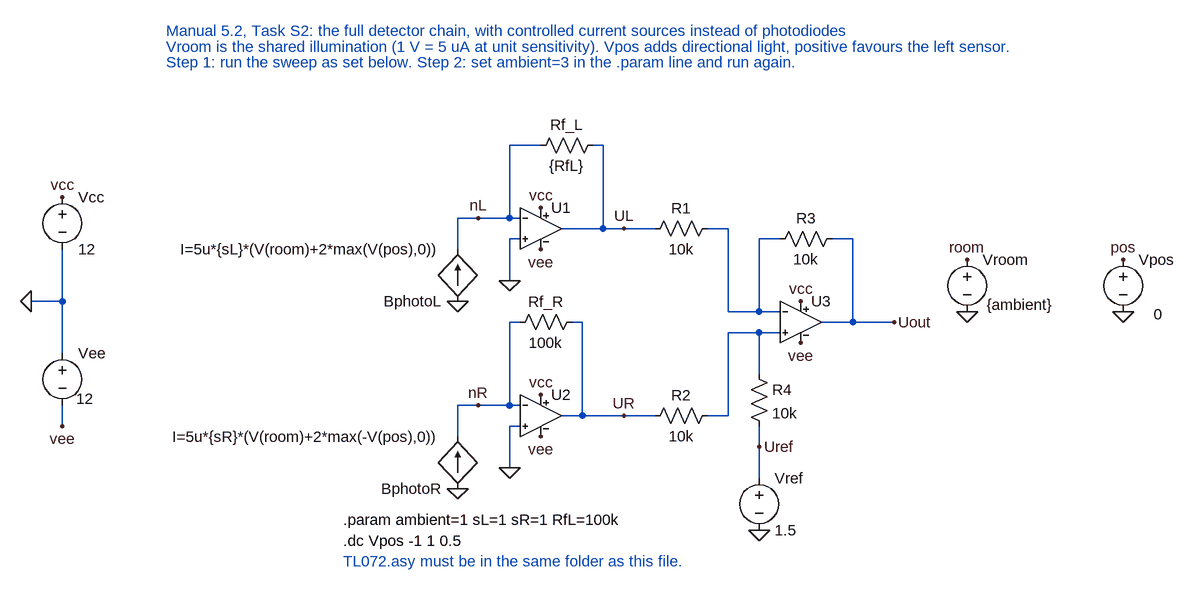
[diagram p0: schematic 5.2_S2_photocurrent_chain_student.asc]
5.2_S2_photocurrent_chain_student.asc, the LTspice schematic file:
Version 4.1
SHEET 1 1536 820
WIRE 400 128 352 128
WIRE 496 128 480 128
WIRE 304 240 272 240
WIRE 352 240 352 128
WIRE 352 240 304 240
WIRE 368 240 352 240
WIRE 496 256 496 128
WIRE 496 256 432 256
WIRE 528 256 496 256
WIRE 576 256 528 256
WIRE 688 256 656 256
WIRE 368 272 352 272
WIRE 768 272 736 272
WIRE 880 272 848 272
WIRE 272 288 272 240
WIRE 352 336 352 272
WIRE -336 368 -336 288
WIRE -336 368 -384 368
WIRE 688 384 688 256
WIRE 736 384 736 272
WIRE 736 384 688 384
WIRE 768 384 736 384
WIRE 368 400 352 400
WIRE 464 400 448 400
WIRE 880 400 880 272
WIRE 880 400 832 400
WIRE 944 400 880 400
WIRE 736 416 688 416
WIRE 768 416 736 416
WIRE -336 448 -336 368
WIRE 736 480 736 416
WIRE 304 528 272 528
WIRE 352 528 352 400
WIRE 352 528 304 528
WIRE 368 528 352 528
WIRE 464 544 464 400
WIRE 464 544 432 544
WIRE 528 544 464 544
WIRE 576 544 528 544
WIRE 688 544 688 416
WIRE 688 544 656 544
WIRE -336 560 -336 528
WIRE 368 560 352 560
WIRE 272 576 272 528
WIRE 736 592 736 560
WIRE 352 624 352 560
WIRE 736 640 736 592
FLAG 304 240 nL
FLAG 352 336 0
FLAG 400 224 vcc
FLAG 400 288 vee
FLAG 272 368 0
FLAG 528 256 UL
FLAG 304 528 nR
FLAG 352 624 0
FLAG 400 512 vcc
FLAG 400 576 vee
FLAG 272 656 0
FLAG 528 544 UR
FLAG 800 368 vcc
FLAG 800 432 vee
FLAG 944 400 Uout
FLAG 736 592 Uref
FLAG 736 720 0
FLAG -336 208 vcc
FLAG -384 368 0
FLAG -336 560 vee
FLAG 1056 304 room
FLAG 1056 384 0
FLAG 1296 304 pos
FLAG 1296 384 0
SYMBOL TL072 400 256 R0
SYMATTR InstName U1
SYMBOL TL072 400 544 R0
SYMATTR InstName U2
SYMBOL TL072 800 400 R0
SYMATTR InstName U3
SYMBOL bi 272 368 R180
SYMATTR InstName BphotoL
SYMATTR Value I=5u*{sL}*(V(room)+2*max(V(pos),0))
SYMBOL bi 272 656 R180
SYMATTR InstName BphotoR
SYMATTR Value I=5u*{sR}*(V(room)+2*max(-V(pos),0))
SYMBOL res 496 112 R90
WINDOW 0 0 56 VBottom 2
WINDOW 3 32 56 VTop 2
SYMATTR InstName Rf_L
SYMATTR Value {RfL}
SYMBOL res 464 384 R90
WINDOW 0 0 56 VBottom 2
WINDOW 3 32 56 VTop 2
SYMATTR InstName Rf_R
SYMATTR Value 100k
SYMBOL res 672 240 R90
WINDOW 0 0 56 VBottom 2
WINDOW 3 32 56 VTop 2
SYMATTR InstName R1
SYMATTR Value 10k
SYMBOL res 672 528 R90
WINDOW 0 0 56 VBottom 2
WINDOW 3 32 56 VTop 2
SYMATTR InstName R2
SYMATTR Value 10k
SYMBOL res 864 256 R90
WINDOW 0 0 56 VBottom 2
WINDOW 3 32 56 VTop 2
SYMATTR InstName R3
SYMATTR Value 10k
SYMBOL res 720 464 R0
SYMATTR InstName R4
SYMATTR Value 10k
SYMBOL voltage 736 624 R0
SYMATTR InstName Vref
SYMATTR Value 1.5
SYMBOL voltage -336 192 R0
SYMATTR InstName Vcc
SYMATTR Value 12
SYMBOL voltage -336 432 R0
WINDOW 3 21 86 Left 2
WINDOW 123 0 0 Left 0
WINDOW 39 0 0 Left 0
SYMATTR InstName Vee
SYMATTR Value 12
SYMBOL voltage 1056 288 R0
WINDOW 3 30 85 Left 2
SYMATTR InstName Vroom
SYMATTR Value {ambient}
SYMBOL voltage 1296 288 R0
WINDOW 3 47 100 Left 2
SYMATTR InstName Vpos
SYMATTR Value 0
TEXT -176 -48 Left 2 ;Manual 5.2, Task S2: the full detector chain, with controlled current sources instead of photodiodes
TEXT -176 -24 Left 2 ;Vroom is the shared illumination (1 V = 5 uA at unit sensitivity). Vpos adds directional light, positive favours the left sensor.
TEXT -176 0 Left 2 ;Step 1: run the sweep as set below. Step 2: set ambient=3 in the .param line and run again.
TEXT 96 704 Left 2 !.param ambient=1 sL=1 sR=1 RfL=100k
TEXT 96 736 Left 2 !.dc Vpos -1 1 0.5
TEXT 96 768 Left 2 ;TL072.asy must be in the same folder as this file.

The netlist it stands for:
* 5.2_S2_photocurrent_chain_student.asc
X§U1 0 nL vcc vee UL level2 Avol=200k GBW=3Meg Slew=13Meg Ilimit=40m Rail=1.5 Vos=0 En=0 Enk=0 In=0 Ink=0 Rin=1T  ; pins In+ In- V+ V- OUT
X§U2 0 nR vcc vee UR level2 Avol=200k GBW=3Meg Slew=13Meg Ilimit=40m Rail=1.5 Vos=0 En=0 Enk=0 In=0 Ink=0 Rin=1T  ; pins In+ In- V+ V- OUT
X§U3 N002 N001 vcc vee Uout level2 Avol=200k GBW=3Meg Slew=13Meg Ilimit=40m Rail=1.5 Vos=0 En=0 Enk=0 In=0 Ink=0 Rin=1T  ; pins In+ In- V+ V- OUT
BphotoL 0 nL I=5u*{sL}*(V(room)+2*max(V(pos),0))
BphotoR 0 nR I=5u*{sR}*(V(room)+2*max(-V(pos),0))
Rf_L UL nL {RfL}
Rf_R UR nR 100k
R1 N001 UL 10k
R2 N002 UR 10k
R3 Uout N001 10k
R4 N002 Uref 10k
Vref Uref 0 1.5
Vcc vcc 0 12
Vee 0 vee 12
Vroom room 0 {ambient}
Vpos pos 0 0
* Manual 5.2, Task S2: the full detector chain, with controlled current sources instead of photodiodes
* Vroom is the shared illumination (1 V = 5 uA at unit sensitivity). Vpos adds directional light, positive favours the left sensor.
* Step 1: run the sweep as set below. Step 2: set ambient=3 in the .param line and run again.
.param ambient=1 sL=1 sR=1 RfL=100k
.dc Vpos -1 1 0.5
* TL072.asy must be in the same folder as this file.
.lib UniversalOpAmp2.lib
.backanno
.end